# Altium schematic sheet Power_Sheet.SchDoc (part 1 of 3)
size 420 x 297 mm; SheetNumber: 2; SheetTotal: 3
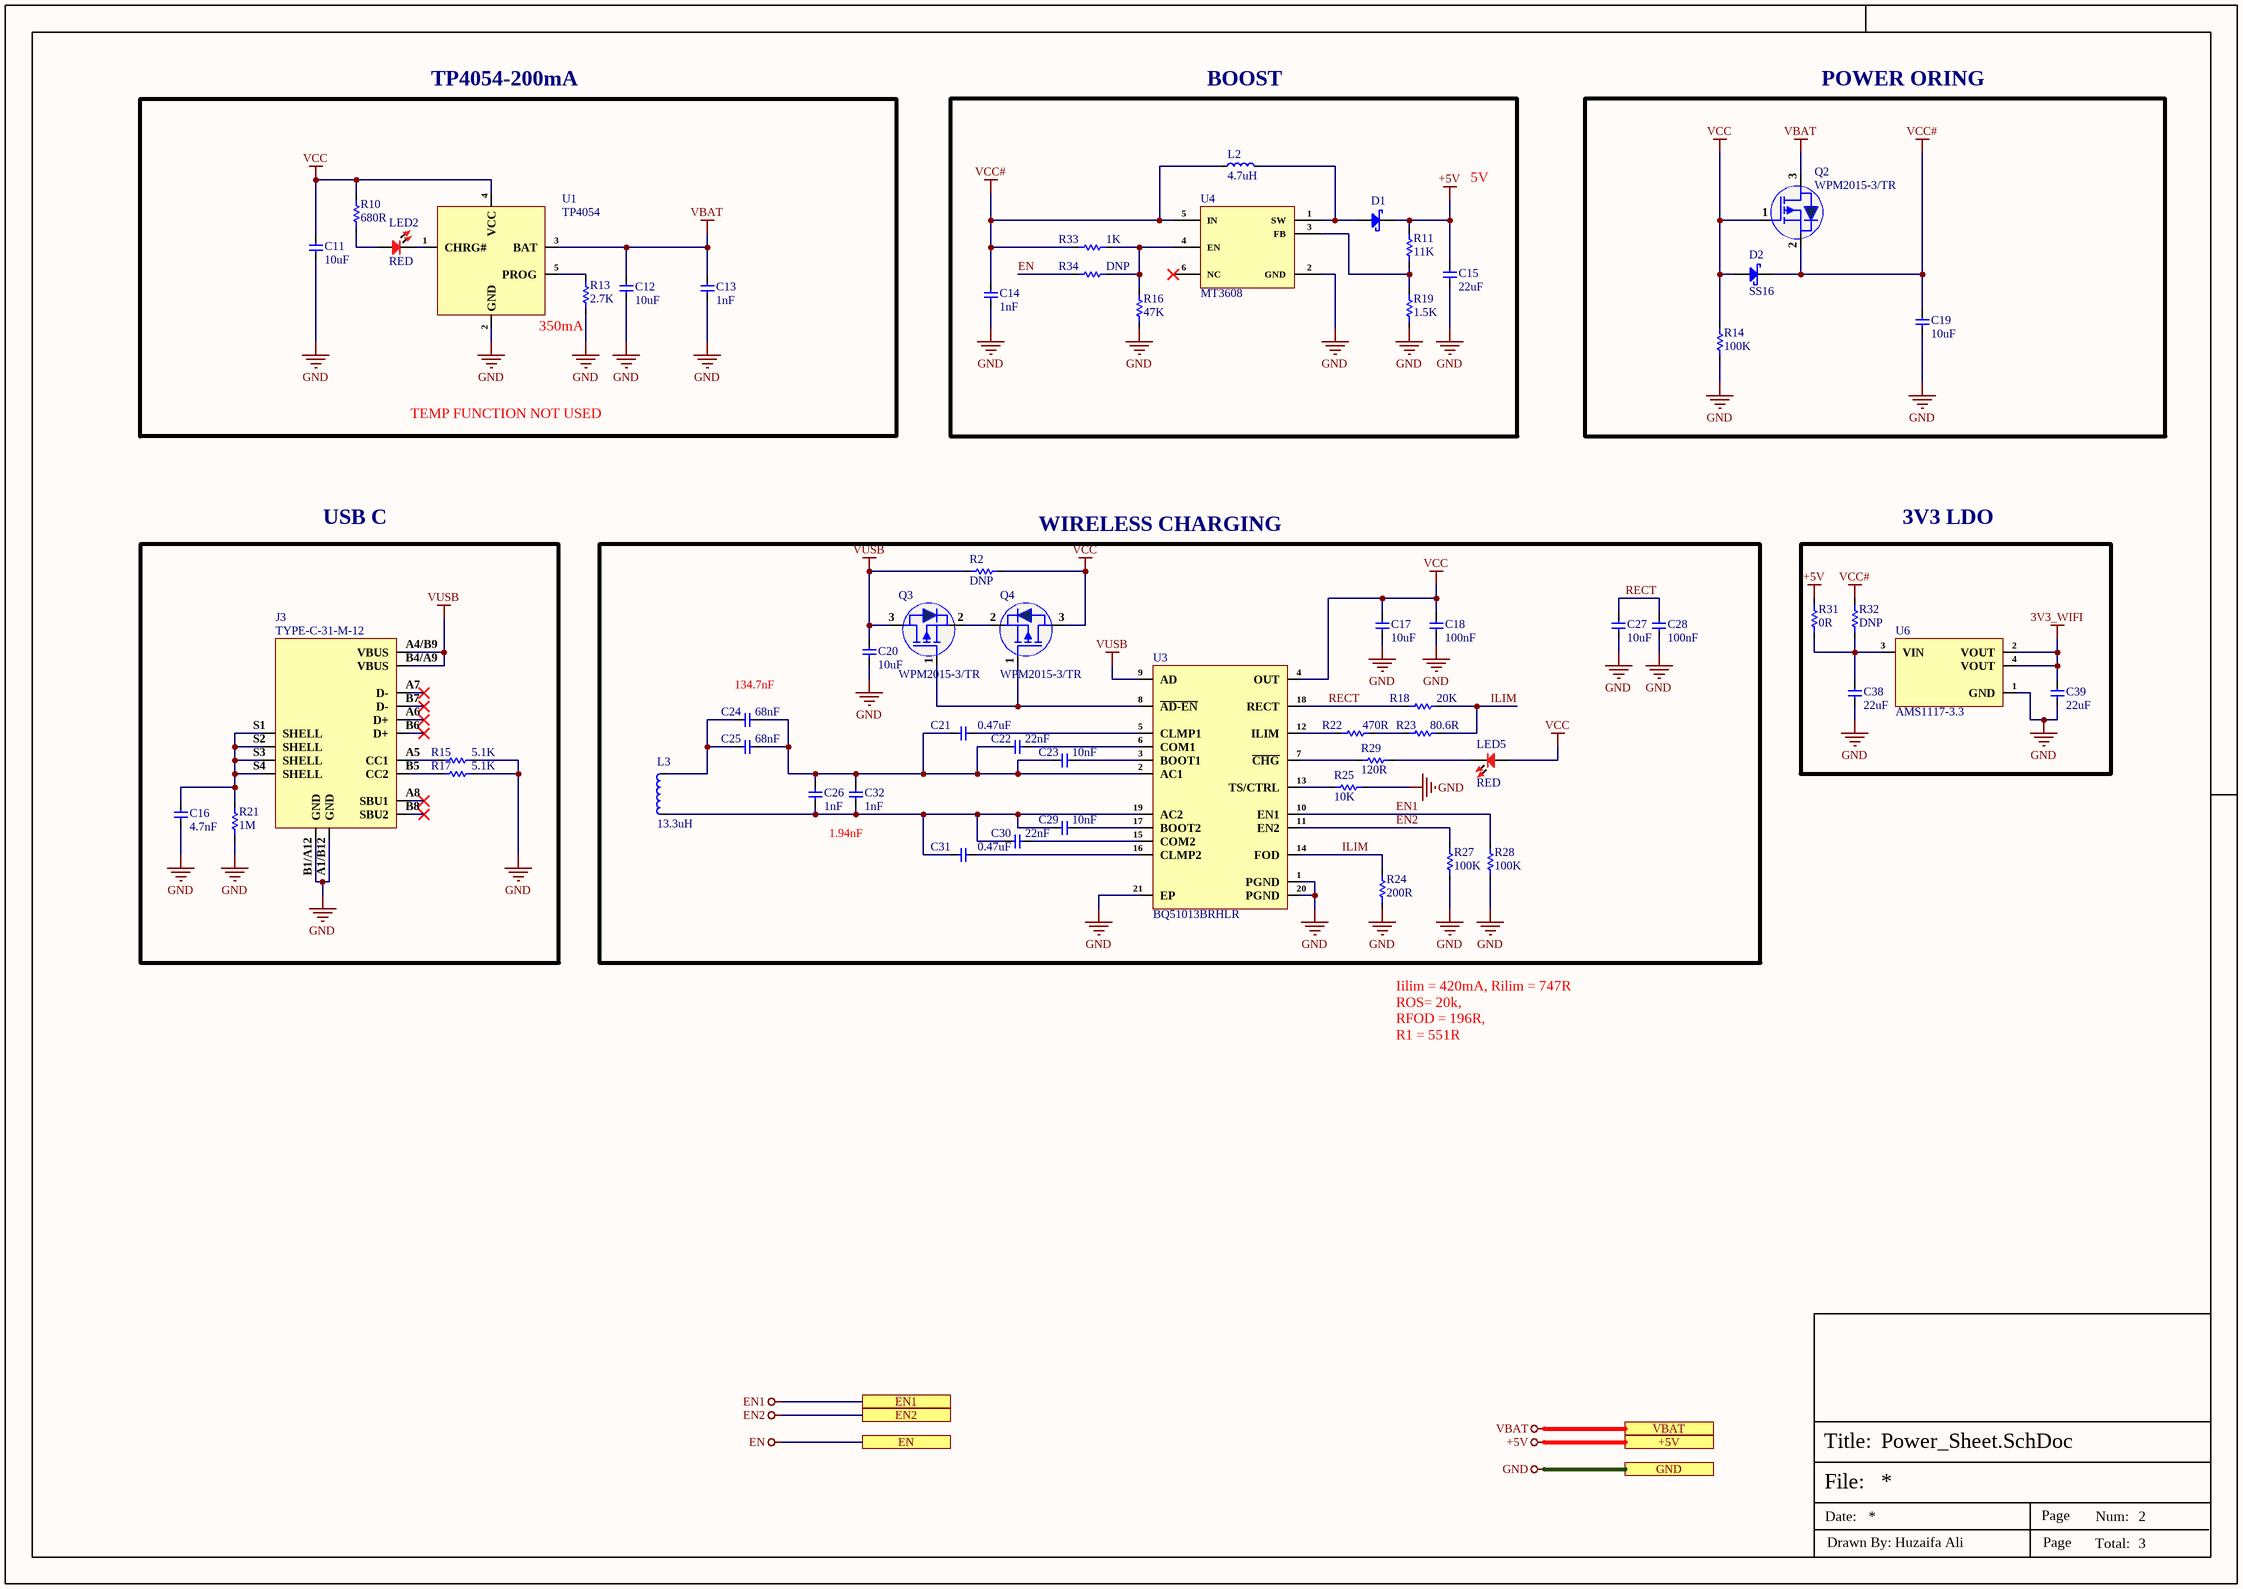
[diagram p0: Power_Sheet.SchDoc]

## Parts
C11  10uF  [Cap-0603]
C12  10uF  [Cap-0603]
C13  1nF  [Cap-0402]
C14  1nF  [Cap-0402]
C15  22uF  [Cap-0805]
C16  4.7nF  [Cap-1206]
C17  10uF  [Cap-0603]
C18  100nF  [Cap-0402]
C19  10uF  [Cap-0603]
C20  10uF  [Cap-0603]
C21  0.47uF  [Cap-0402]
C22  22nF  [Cap-0402]
C23  10nF  [Cap-0402]
C24  68nF  [Cap-0402]
C25  68nF  [Cap-0402]
C26  1nF  [Cap-0402]
C27  10uF  [Cap-0603]
C28  100nF  [Cap-0402]
C29  10nF  [Cap-0402]
C30  22nF  [Cap-0402]
C31  0.47uF  [Cap-0402]
C32  1nF  [Cap-0402]
C38  22uF  [Cap-0603]
C39  22uF  [Cap-0603]
D1  SS32 /SMA(DO-214AC)  [SMA]  (value not drawn)
D2  SS16  [SMA]
J3  TYPE-C-31-M-12  [TYPE-C-31-M-12_]
L2  4.7uH  [SPH4012H4R7MT]
L3  13.3uH  [Th Hole Test Point (3.7mm Drill 6mm pad)]
LED2  RED  [LED-0603]
LED5  RED  [LED-0603]
Q2  WPM2015-3/TR  [Sot-23]
Q3  WPM2015-3/TR  [Sot-23]
Q4  WPM2015-3/TR  [Sot-23]
R2  DNP  [Res-0805]
R10  680R  [Res-0402]
R11  11K  [Res-0402]
R13  2.7K  [Res-0402]
R14  100K  [Res-0402]
R15  5.1K  [Res-0402]
R16  47K  [Res-0402]
R17  5.1K  [Res-0402]
R18  20K  [Res-0402]
R19  1.5K  [Res-0402]
R21  1M  [Res-0603]
R22  470R  [Res-0402]
R23  80.6R  [Res-0402]
R24  200R  [Res-0402]
R25  10K  [Res-0402]
R27  100K  [Res-0402]
R28  100K  [Res-0402]
R29  120R  [Res-0402]
R31  0R  [Res-0603]
R32  DNP  [Res-0603]
R33  1K  [Res-0402]
R34  DNP  [Res-0603]
U1  TP4054  [SOT-23-5]
U3  BQ51013BRHLR  [20-VQFN (3.5x4.5)]
U4  MT3608  [SOT-23-6]
U6  AMS1117-3.3  [SOT- 223]

## Blocks framed on the sheet
TP4054-200mA: C11-C13 LED2 R10 R13 U1
BOOST: C14 C15 D1 L2 R11 R16 R19 R33 R34 U4
POWER ORING: C19 D2 Q2 R14
USB C: C16 J3 R15 R17 R21
WIRELESS CHARGING: C17 C18 C20-C32 L3 LED5 Q3 Q4 R2 R18 R22-R25 R27-R29 U3
3V3 LDO: C38 C39 R31 R32 U6

## Ports
+5V, EN, EN1, EN2, GND, VBAT

## Nets
3V3_WIFI: C39.2 U6.2(VOUT) U6.4(VOUT)
+5V: C15.2 D1.1(K) R11.2 R31.2 ; port +5V
EN: R34.1 ; port EN
EN1: R28.2 U3.10(EN1) ; port EN1
EN2: R27.1 U3.11(EN2) ; port EN2
GND: C11.1 C12.1 C13.1 C14.1 C15.1 C16.1 C17.1 C18.1 C19.1 C20.2 C27.1 C28.1 C38.1 C39.1 J3.A1/B12(GND) J3.B1/A12(GND) R13.1 R14.1 R15.2 R16.1 R17.2 R19.1 R21.1 R24.1 R25.2 R27.2 R28.1 U1.2(GND) U3.1(PGND) U3.20(PGND) U3.21(EP) U4.2(GND) U6.1(GND) ; port GND
VBAT: C12.2 C13.2 Q2.3(D) U1.3(BAT) ; port VBAT
VCC: C11.2 C17.2 C18.2 D2.2(A) LED5.1 Q2.1(G) Q4.3(D) R2.2 R10.2 R14.2 U1.4(VCC) U3.4(OUT)
VCC#: C14.2 C19.2 D2.1(K) L2.1 Q2.2(S) R32.2 R33.2 U4.5(IN)
VUSB: C20.1 J3.A4/B9(VBUS) J3.B4/A9(VBUS) Q3.3(D) R2.1 U3.9(AD)
ILIM: R18.2 R23.2 R24.2 U3.14(FOD)
RECT: C27.2 C28.2 R18.1 U3.18(RECT)
NetC16_2: C16.2 J3.S1(SHELL) J3.S2(SHELL) J3.S3(SHELL) J3.S4(SHELL) R21.2
NetC21_1: C21.1 C22.1 C23.1 C24.2 C25.2 C26.2 C32.2 U3.2(AC1)
NetC21_2: C21.2 U3.5(CLMP1)
NetC22_2: C22.2 U3.6(COM1)
NetC23_2: C23.2 U3.3(BOOT1)
NetC24_1: C24.1 C25.1 L3.2
NetC26_1: C26.1 C29.1 C30.1 C31.1 C32.1 L3.1 U3.19(AC2)
NetC29_2: C29.2 U3.17(BOOT2)
NetC30_2: C30.2 U3.15(COM2)
NetC31_2: C31.2 U3.16(CLMP2)
NetC38_2: C38.2 R31.1 R32.1 U6.3(VIN)
NetD1_2: D1.2(A) L2.2 U4.1(SW)
NetJ3_A5: J3.A5(CC1) R15.1
NetJ3_B5: J3.B5(CC2) R17.1
NetLED2_1: LED2.1 R10.1
NetLED2_2: LED2.2 U1.1(CHRG#)
NetLED5_2: LED5.2 R29.1
NetQ3_1: Q3.1(G) Q4.1(G) U3.8(~{AD-EN})
NetQ3_2: Q3.2(S) Q4.2(S)
NetR11_1: R11.1 R19.2 U4.3(FB)
NetR13_2: R13.2 U1.5(PROG)
NetR16_2: R16.2 R33.1 R34.2 U4.4(EN)
NetR22_1: R22.1 U3.12(ILIM)
NetR22_2: R22.2 R23.1
NetR25_1: R25.1 U3.13(TS/CTRL)
NetR29_2: R29.2 U3.7(~{CHG})

Not connected (* = marked no-connect by the designer): J3 A6(D+)* A7(D-)* A8(SBU1)* B6(D+)* B7(D-)* B8(SBU2)*; U4 6(NC)*

## Notes on the sheet
- 5V
- (near U1) 350mA
- TEMP FUNCTION NOT USED
- (near C24) 134.7nF
- 1.94nF
- Iilim = 420mA, Rilim = 747R
  ROS= 20k,
  RFOD = 196R,
  R1 = 551R
- File:
- Title:
- Date:
- Page
- Num:
- Total:
- Drawn By: Huzaifa Ali